# Altium schematic sheet Feedback.SchDoc
size A4
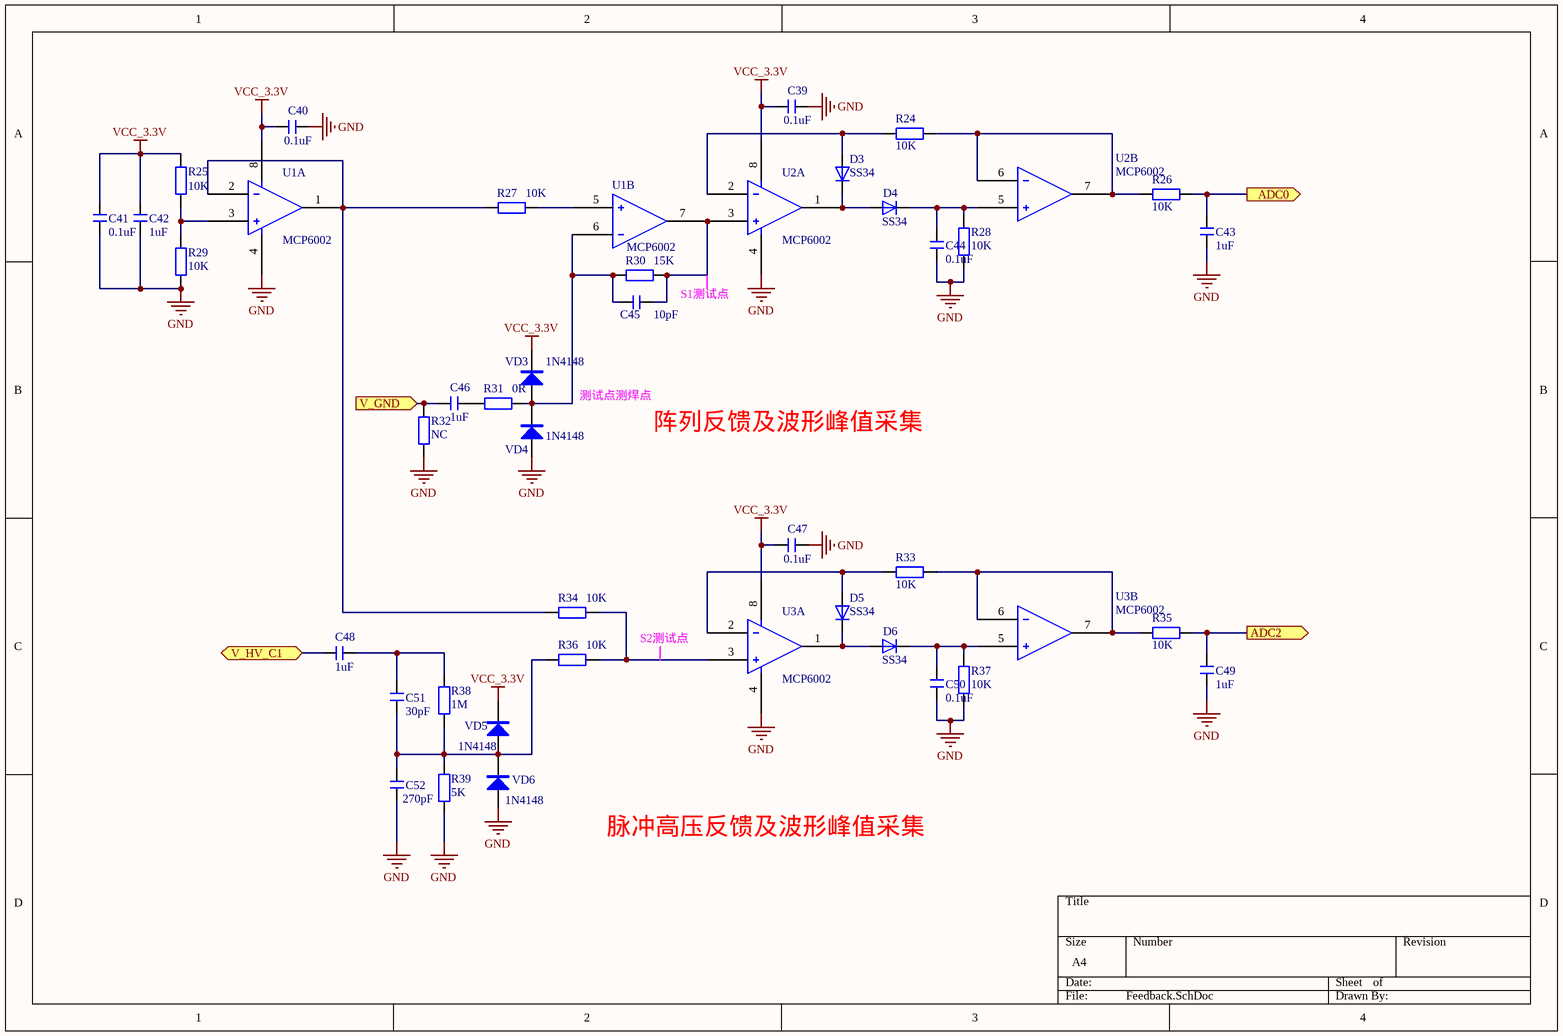
[diagram p0: Feedback.SchDoc]

## Parts
C39  0.1uF  [C 0603]
C40  0.1uF  [C 0603]
C41  0.1uF  [C 0603]
C42  1uF  [C 0603]
C43  1uF  [C 0603]
C44  0.1uF  [C 0603]
C45  10pF  [C 0603]
C46  1uF  [C 0805]
C47  0.1uF  [C 0603]
C48  1uF  [C 0805]
C49  1uF  [C 0603]
C50  0.1uF  [C 0603]
C51  30pF  [C 0805]
C52  270pF  [C 0805]
D3  SS34  [SMA]
D4  SS34  [SMA]
D5  SS34  [SMA]
D6  SS34  [SMA]
R24  10K  [R 0603]
R25  10K  [R 0603]
R26  10K  [R 0603]
R27  10K  [R 0603]
R28  10K  [R 0603]
R29  10K  [R 0603]
R30  15K  [R 0603]
R31  0R  [R 0603]
R32  NC  [R 0805]
R33  10K  [R 0603]
R34  10K  [R 0603]
R35  10K  [R 0603]
R36  10K  [R 0603]
R37  10K  [R 0603]
R38  1M  [R 0805]
R39  5K  [R 0805]
U1  MCP6002  [SOP8_N]  (parts A,B of 2)
U2  MCP6002  [SOP8_N]  (parts A,B of 2)
U3  MCP6002  [SOP8_N]  (parts A,B of 2)
VD3  1N4148  [SOD-323]
VD4  1N4148  [SOD-323]
VD5  1N4148  [SOD-323]
VD6  1N4148  [SOD-323]

## Ports
ADC0 (out), ADC2 (out), V_GND (in), V_HV_C1

## Nets
GND: C39.2 C40.2 C41.2 C42.2 C43.1 C44.1 C47.2 C49.1 C50.1 C52.1 R28.2 R29.1 R32.2 R37.2 R39.1 U1.4 U2.4 U3.4 VD4.1(A) VD6.1(A)
VCC_3.3V: C39.1 C40.1 C41.1 C42.1 C47.1 R25.2 U1.8 U2.8 U3.8 VD3.2(K) VD5.2(K)
ADC0: C43.2 R26.1 ; port ADC0
ADC2: C49.2 R35.1 ; port ADC2
V_GND: C46.1 R32.1 ; port V_GND
V_HV_C1: C48.1 ; port V_HV_C1
NetC44_2: C44.2 D4.2(A) R28.1 U2.5
NetC45_1: C45.1 R30.2 R31.1 U1.6 VD3.1(A) VD4.2(K)
NetC45_2: C45.2 R30.1 U1.7 U2.3
NetC46_2: C46.2 R31.2
NetC48_2: C48.2 C51.2 R38.2
NetC50_2: C50.2 D6.2(A) R37.1 U3.5
NetC51_1: C51.1 C52.2 R36.2 R38.1 R39.2 VD5.1(A) VD6.2(K)
NetD3_1: D3.1(K) R24.2 U2.2
NetD3_2: D3.2(A) D4.1(K) U2.1
NetD5_1: D5.1(K) R33.2 U3.2
NetD5_2: D5.2(A) D6.1(K) U3.1
NetR24_1: R24.1 R26.2 U2.6 U2.7
NetR25_1: R25.1 R29.2 U1.3
NetR27_1: R27.1 U1.5
NetR27_2: R27.2 R34.2 U1.1 U1.2
NetR33_1: R33.1 R35.2 U3.6 U3.7
NetR34_1: R34.1 R36.1 U3.3

## Notes on the sheet
- S1测试点
- 测试点测焊点
- 阵列反馈及波形峰值采集
- S2测试点
- 脉冲高压反馈及波形峰值采集

## Library data of the parts
C39-C52 = C: 无极性贴片电容; 版权归属: 源创客; BOM名称: 无极性贴片电容; 学习资源: www.ooocke.com
D3-D6 = 1N4148
R24-R39 = R: 贴片电阻; 版权归属: 源创客; BOM名称: 贴片电阻; 学习资源: www.ooocke.com
U1-U3 = AD823AN
VD3-VD6 = 1N4148: 高速开关二极管; 版权归属: 源创客; BOM名称: 高速开关二极管; 学习资源: www.ooocke.com